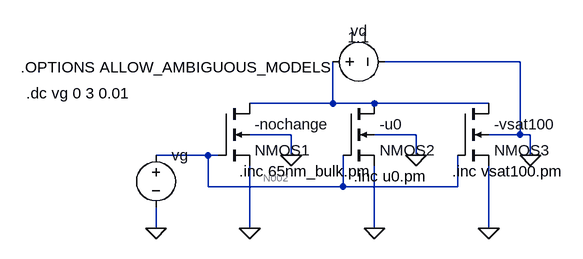
[diagram p0: schematic s4.asc]
s4.asc, the LTspice schematic file:
Version 4.1
SHEET 1 880 680
WIRE 656 112 448 112
WIRE 368 176 368 112
WIRE 368 176 240 176
WIRE 432 176 368 176
WIRE 608 176 432 176
WIRE 304 224 240 224
WIRE 496 224 432 224
WIRE 656 224 656 112
WIRE 656 224 608 224
WIRE 672 224 656 224
WIRE 176 256 96 256
WIRE 192 256 176 256
WIRE 304 256 304 224
WIRE 496 256 496 224
WIRE 672 256 672 224
WIRE 176 304 176 256
WIRE 384 304 384 256
WIRE 384 304 176 304
WIRE 560 304 560 256
WIRE 560 304 384 304
WIRE 96 368 96 336
WIRE 240 368 240 272
WIRE 432 368 432 272
WIRE 608 368 608 272
FLAG 96 368 0
FLAG 240 368 0
FLAG 304 256 0
FLAG 432 368 0
FLAG 496 256 0
FLAG 608 368 0
FLAG 672 256 0
SYMBOL nmos4 192 176 R0
SYMATTR InstName -nochange
SYMATTR Value2 l=65nm w=1um
SYMATTR Value NMOS1
SYMBOL voltage 96 240 R0
WINDOW 123 0 0 Left 0
WINDOW 39 0 0 Left 0
WINDOW 3 24 26 Left 2
SYMATTR Value ""
SYMATTR InstName vg
SYMBOL voltage 352 112 R270
WINDOW 0 32 56 VTop 2
WINDOW 3 22 56 VTop 2
WINDOW 123 0 0 Left 0
WINDOW 39 0 0 Left 0
SYMATTR InstName vd
SYMATTR Value 1.1
SYMBOL nmos4 384 176 R0
SYMATTR InstName -u0
SYMATTR Value2 l=65nm w=1um
SYMATTR Value NMOS2
SYMBOL nmos4 560 176 R0
SYMATTR InstName -vsat100
SYMATTR Value2 l=65nm w=1um
SYMATTR Value NMOS3
TEXT 224 280 Left 2 !.inc 65nm_bulk.pm
TEXT -112 120 Left 2 !.OPTIONS ALLOW_AMBIGUOUS_MODELS
TEXT -104 160 Left 2 !.dc vg 0 3 0.01
TEXT 552 280 Left 2 !.inc vsat100.pm
TEXT 400 288 Left 2 !.inc u0.pm

The netlist it stands for:
* s4.asc
M§-nochange N001 N002 0 0 NMOS1 l=65nm w=1um
vg N002 0
vd N001 0 1.1
M§-u0 N001 N002 0 0 NMOS2 l=65nm w=1um
M§-vsat100 N001 N002 0 0 NMOS3 l=65nm w=1um
.model NMOS NMOS
.model PMOS PMOS
.lib standard.mos
.inc 65nm_bulk.pm
.OPTIONS ALLOW_AMBIGUOUS_MODELS
.dc vg 0 3 0.01
.inc vsat100.pm
.inc u0.pm
.backanno
.end

* Results of the author's LTspice run, read from the files saved beside the schematic
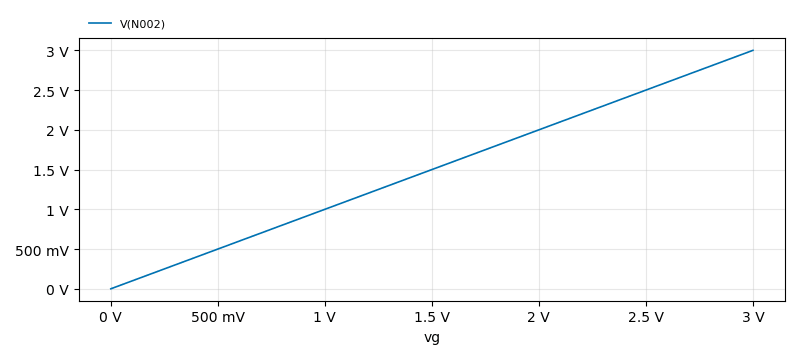
[diagram p1: DC transfer characteristic of s4.asc, plotted from the saved traces]
* DC transfer characteristic, 1 run:
*   V(N002): 0 V at vg=0 V, 3 V at vg=3 V, min 0 V, max 3 V